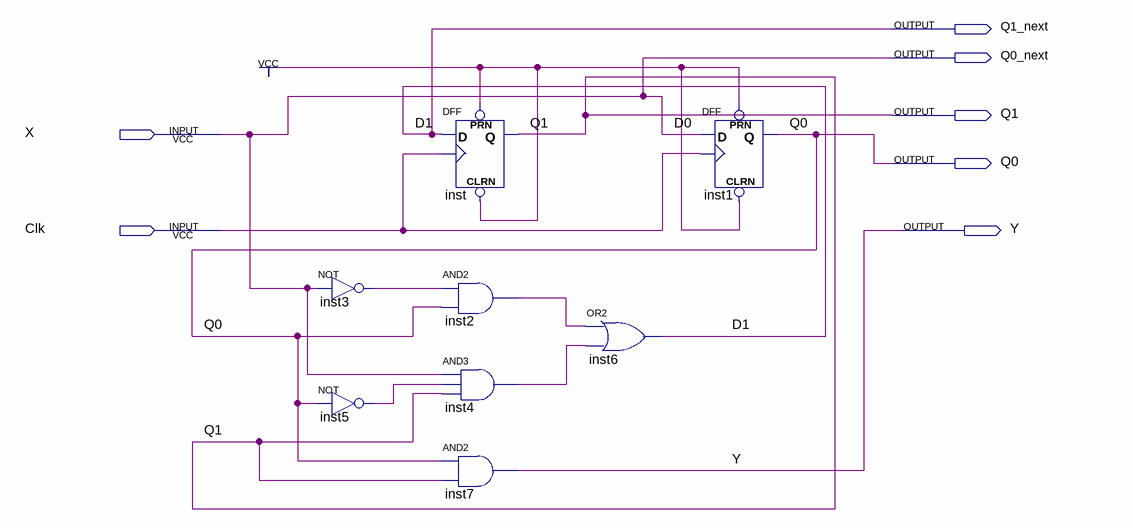
[diagram p0: schematic sheet]
// Quartus schematic moore_fsm.bdf as structural Verilog: 8 symbols, 7 pins
module moore_fsm (
  input  X,
  input  Clk,
  output Q1_next,
  output Q0_next,
  output Q1,
  output Q0,
  output Y
);

  wire inst2_out, inst3_out, inst4_out, inst5_out;

  not inst3 (inst3_out, X);
  not inst5 (inst5_out, Q0);
  DFF inst (.CLRN(1'b1), .CLK(Clk), .D(Q1_next), .PRN(1'b1), .Q(Q1));
  and inst2 (inst2_out, inst3_out, Q0);
  and inst4 (inst4_out, X, inst5_out, Q1);
  and inst7 (Y, Q0, Q1);
  or inst6 (Q1_next, inst2_out, inst4_out);
  DFF inst1 (.CLRN(1'b1), .CLK(Clk), .D(X), .PRN(1'b1), .Q(Q0));

  assign Q0_next = X;

  // Other names for the same wires on the sheet: D1 = Q1_next; D0 = X
endmodule
